# Altium schematic sheet 00_Top.SchDoc
size A4; SheetNumber: 1; SheetTotal: 6
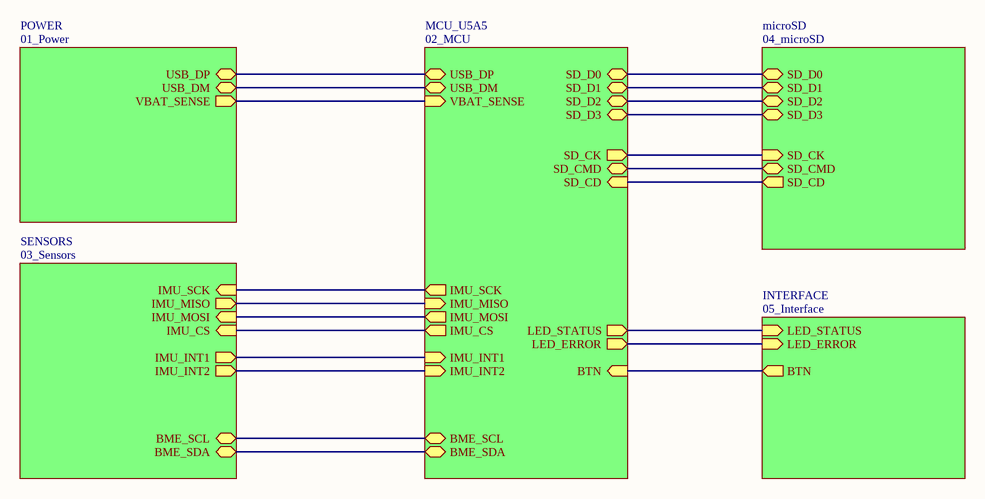
[diagram p0: 00_Top.SchDoc]

## Sub-sheets
INTERFACE = 05_Interface: LED_STATUS (in), LED_ERROR (in), BTN (out)
MCU_U5A5 = 02_MCU: LED_STATUS (out), LED_ERROR (out), BTN (in), SD_D0 (bidir), SD_D1 (bidir), SD_D2 (bidir), SD_D3 (bidir), SD_CK (out), SD_CMD (bidir), SD_CD (in), BME_SDA (bidir), BME_SCL (bidir), USB_DP (bidir), USB_DM (bidir), VBAT_SENSE (in), IMU_SCK (out), IMU_MISO (in), IMU_MOSI (out), IMU_CS (out), IMU_INT1 (in), IMU_INT2 (in)
microSD = 04_microSD: SD_D0 (bidir), SD_D1 (bidir), SD_D2 (bidir), SD_D3 (bidir), SD_CK (in), SD_CMD (bidir), SD_CD (out)
POWER = 01_Power: USB_DP (bidir), USB_DM (bidir), VBAT_SENSE (out)
SENSORS = 03_Sensors: BME_SDA (bidir), BME_SCL (bidir), IMU_INT2 (out), IMU_INT1 (out), IMU_CS (in), IMU_MOSI (in), IMU_SCK (in), IMU_MISO (out)

## Nets
(unnamed): sheet MCU_U5A5/LED_STATUS, sheet INTERFACE/LED_STATUS
(unnamed): sheet MCU_U5A5/LED_ERROR, sheet INTERFACE/LED_ERROR
(unnamed): sheet MCU_U5A5/BTN, sheet INTERFACE/BTN
(unnamed): sheet MCU_U5A5/SD_D0, sheet microSD/SD_D0
(unnamed): sheet MCU_U5A5/SD_D1, sheet microSD/SD_D1
(unnamed): sheet MCU_U5A5/SD_D2, sheet microSD/SD_D2
(unnamed): sheet MCU_U5A5/SD_D3, sheet microSD/SD_D3
(unnamed): sheet MCU_U5A5/SD_CK, sheet microSD/SD_CK
(unnamed): sheet MCU_U5A5/SD_CMD, sheet microSD/SD_CMD
(unnamed): sheet MCU_U5A5/SD_CD, sheet microSD/SD_CD
(unnamed): sheet MCU_U5A5/BME_SDA, sheet SENSORS/BME_SDA
(unnamed): sheet MCU_U5A5/BME_SCL, sheet SENSORS/BME_SCL
(unnamed): sheet MCU_U5A5/USB_DP, sheet POWER/USB_DP
(unnamed): sheet MCU_U5A5/USB_DM, sheet POWER/USB_DM
(unnamed): sheet MCU_U5A5/VBAT_SENSE, sheet POWER/VBAT_SENSE
(unnamed): sheet MCU_U5A5/IMU_SCK, sheet SENSORS/IMU_SCK
(unnamed): sheet MCU_U5A5/IMU_MISO, sheet SENSORS/IMU_MISO
(unnamed): sheet MCU_U5A5/IMU_MOSI, sheet SENSORS/IMU_MOSI
(unnamed): sheet MCU_U5A5/IMU_CS, sheet SENSORS/IMU_CS
(unnamed): sheet MCU_U5A5/IMU_INT1, sheet SENSORS/IMU_INT1
(unnamed): sheet MCU_U5A5/IMU_INT2, sheet SENSORS/IMU_INT2